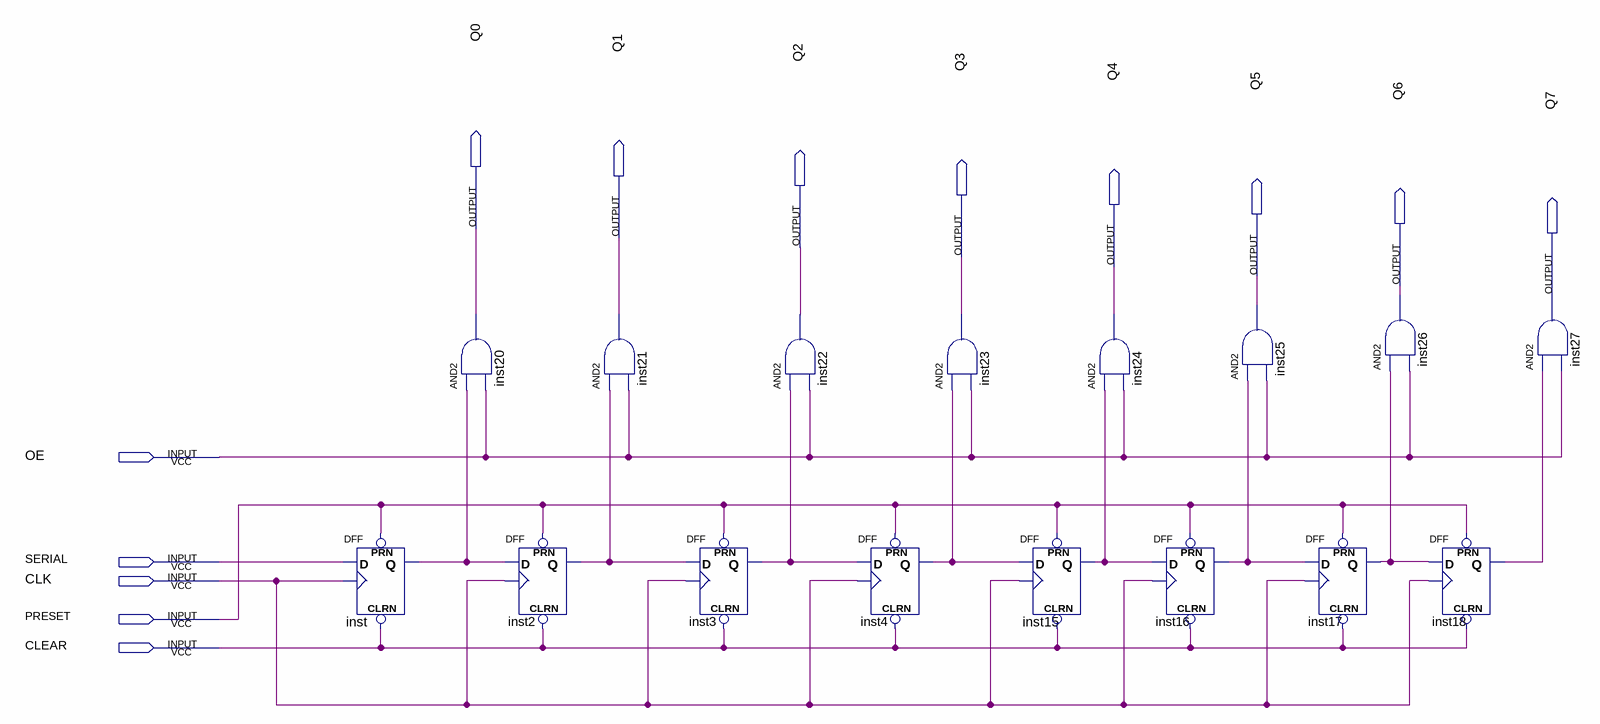
[diagram p0: schematic sheet]
// Quartus schematic SIPO.bdf as structural Verilog: 16 symbols, 13 pins
module SIPO (
  input  OE,
  input  SERIAL,
  input  CLK,
  input  PRESET,
  input  CLEAR,
  output Q0,
  output Q1,
  output Q2,
  output Q3,
  output Q4,
  output Q5,
  output Q6,
  output Q7
);

  wire inst2_q, inst3_q, inst4_q, inst15_q, inst16_q, inst17_q, inst18_q, inst_q;

  DFF inst (.CLRN(CLEAR), .CLK(CLK), .D(SERIAL), .PRN(PRESET), .Q(inst_q));
  and inst20 (Q0, inst_q, OE);
  DFF inst2 (.CLRN(CLEAR), .CLK(CLK), .D(inst_q), .PRN(PRESET), .Q(inst2_q));
  and inst21 (Q1, inst2_q, OE);
  DFF inst3 (.CLRN(CLEAR), .CLK(CLK), .D(inst2_q), .PRN(PRESET), .Q(inst3_q));
  and inst22 (Q2, inst3_q, OE);
  DFF inst4 (.CLRN(CLEAR), .CLK(CLK), .D(inst3_q), .PRN(PRESET), .Q(inst4_q));
  and inst23 (Q3, inst4_q, OE);
  DFF inst15 (.CLRN(CLEAR), .CLK(CLK), .D(inst4_q), .PRN(PRESET), .Q(inst15_q));
  and inst24 (Q4, inst15_q, OE);
  DFF inst16 (.CLRN(CLEAR), .CLK(CLK), .D(inst15_q), .PRN(PRESET), .Q(inst16_q));
  and inst25 (Q5, inst16_q, OE);
  DFF inst17 (.CLRN(CLEAR), .CLK(CLK), .D(inst16_q), .PRN(PRESET), .Q(inst17_q));
  and inst26 (Q6, inst17_q, OE);
  DFF inst18 (.CLRN(CLEAR), .CLK(CLK), .D(inst17_q), .PRN(PRESET), .Q(inst18_q));
  and inst27 (Q7, inst18_q, OE);
endmodule
